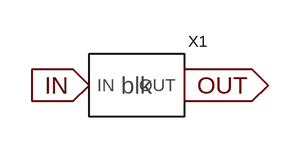
[diagram p0: schematic outer.asc]
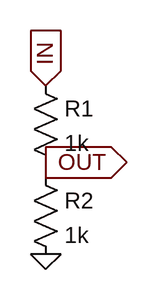
[diagram p1: sub-circuit blk.asc]
outer.asc, the LTspice schematic file:
Version 4
SHEET 1 880 680
FLAG 112 16 IN
IOPIN 112 16 In
FLAG 208 16 OUT
IOPIN 208 16 Out
SYMBOL blk 160 16 R0
SYMATTR InstName X1

blk.asc, the sub-circuit schematic file:
Version 4
SHEET 1 880 680
WIRE 0 96 0 112
FLAG 0 16 IN
IOPIN 0 16 In
FLAG 0 96 OUT
IOPIN 0 96 Out
FLAG 0 192 0
SYMBOL res -16 0 R0
SYMATTR InstName R1
SYMATTR Value 1k
SYMBOL res -16 96 R0
SYMATTR InstName R2
SYMATTR Value 1k

The netlist it stands for:
* outer.asc
XX1 IN OUT blk

* block symbol definitions
.subckt blk IN OUT
R1 IN OUT 1k
R2 OUT 0 1k
.ends blk

.backanno
.end